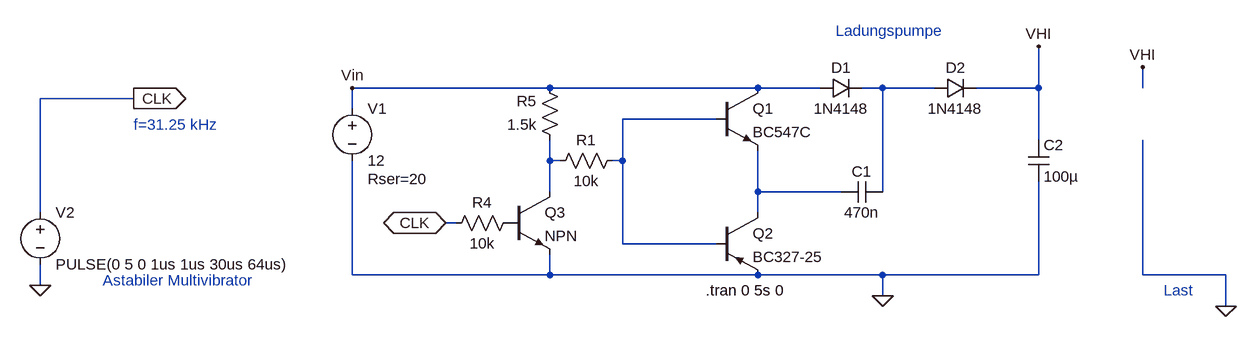
[diagram p0: schematic MCDriverVDouble.asc]
MCDriverVDouble.asc, the LTspice schematic file:
Version 4
SHEET 1 1188 820
WIRE 16 48 -288 48
WIRE 336 48 16 48
WIRE 432 48 336 48
WIRE 528 48 496 48
WIRE 608 48 528 48
WIRE 768 48 768 -16
WIRE 768 48 672 48
WIRE 928 48 928 16
WIRE -624 64 -768 64
WIRE -288 80 -288 48
WIRE 272 96 128 96
WIRE 768 128 768 48
WIRE 16 160 16 128
WIRE 32 160 16 160
WIRE 128 160 128 96
WIRE 128 160 112 160
WIRE 16 208 16 160
WIRE 336 208 336 144
WIRE 464 208 336 208
WIRE 528 208 528 48
WIRE -768 240 -768 64
WIRE 336 240 336 208
WIRE -128 256 -144 256
WIRE 128 288 128 160
WIRE 272 288 128 288
WIRE -288 336 -288 160
WIRE 16 336 16 304
WIRE 16 336 -288 336
WIRE 336 336 16 336
WIRE 528 336 336 336
WIRE 768 336 768 192
WIRE 768 336 528 336
WIRE 928 336 928 128
WIRE 1056 336 928 336
WIRE -768 352 -768 320
WIRE 528 368 528 336
WIRE 1056 384 1056 336
FLAG 528 368 0
FLAG -144 256 CLK
IOPIN -144 256 BiDir
FLAG -768 352 0
FLAG -288 48 Vin
FLAG -624 64 CLK
IOPIN -624 64 Out
FLAG 768 -16 VHI
FLAG 1056 384 0
FLAG 928 16 VHI
SYMBOL voltage -288 64 R0
WINDOW 123 0 0 Left 0
WINDOW 39 24 124 Left 2
SYMATTR SpiceLine Rser=20
SYMATTR InstName V1
SYMATTR Value 12
SYMBOL diode 432 64 R270
WINDOW 0 32 32 VTop 2
WINDOW 3 0 32 VBottom 2
SYMATTR InstName D1
SYMATTR Value 1N4148
SYMBOL diode 608 64 R270
WINDOW 0 32 32 VTop 2
WINDOW 3 0 32 VBottom 2
SYMATTR InstName D2
SYMATTR Value 1N4148
SYMBOL cap 528 192 R90
WINDOW 0 0 32 VBottom 2
WINDOW 3 32 32 VTop 2
SYMATTR InstName C1
SYMATTR Value 470n
SYMBOL cap 752 128 R0
SYMATTR InstName C2
SYMATTR Value 100µ
SYMBOL voltage -768 224 R0
WINDOW 123 0 0 Left 0
WINDOW 39 0 0 Left 0
SYMATTR InstName V2
SYMATTR Value PULSE(0 5 0 1us 1us 30us 64us)
SYMBOL npn 272 48 R0
SYMATTR InstName Q1
SYMATTR Value BC547C
SYMBOL pnp 272 240 R0
SYMATTR InstName Q2
SYMATTR Value BC327-25
SYMBOL npn -48 208 R0
SYMATTR InstName Q3
SYMBOL res -32 240 R90
WINDOW 0 0 56 VBottom 2
WINDOW 3 32 56 VTop 2
SYMATTR InstName R4
SYMATTR Value 10k
SYMBOL res 32 144 R180
WINDOW 0 36 76 Left 2
WINDOW 3 36 40 Left 2
SYMATTR InstName R5
SYMATTR Value 1.5k
SYMBOL res 128 144 R90
WINDOW 0 0 56 VBottom 2
WINDOW 3 32 56 VTop 2
SYMATTR InstName R1
SYMATTR Value 10k
TEXT 256 360 Left 2 !.tran 0 5s 0
TEXT -672 344 Left 2 ;Astabiler Multivibrator
TEXT 456 -40 Left 2 ;Ladungspumpe
TEXT -624 104 Left 2 ;f=31.25 kHz
TEXT 960 360 Left 2 ;Last

The netlist it stands for:
* MCDriverVDouble.asc
V1 Vin 0 12 Rser=20
D1 Vin N001 1N4148
D2 N001 VHI 1N4148
C1 N001 N004 470n
C2 VHI 0 100µ
V2 CLK 0 PULSE(0 5 0 1us 1us 30us 64us)
Q1 Vin N002 N004 0 BC547C
Q2 N004 N002 0 0 BC327-25
Q3 N003 P001 0 0 NPN
R4 P001 CLK 10k
R5 N003 Vin 1.5k
R1 N002 N003 10k
.model D D
.lib standard.dio
.model NPN NPN
.model PNP PNP
.lib standard.bjt
.tran 0 5s 0
* Astabiler Multivibrator
* Ladungspumpe
* f=31.25 kHz
* Last
.backanno
.end